# Altium schematic sheet RAM_Sheet_2.SchDoc
size A4; SheetNumber: 19; SheetTotal: 22
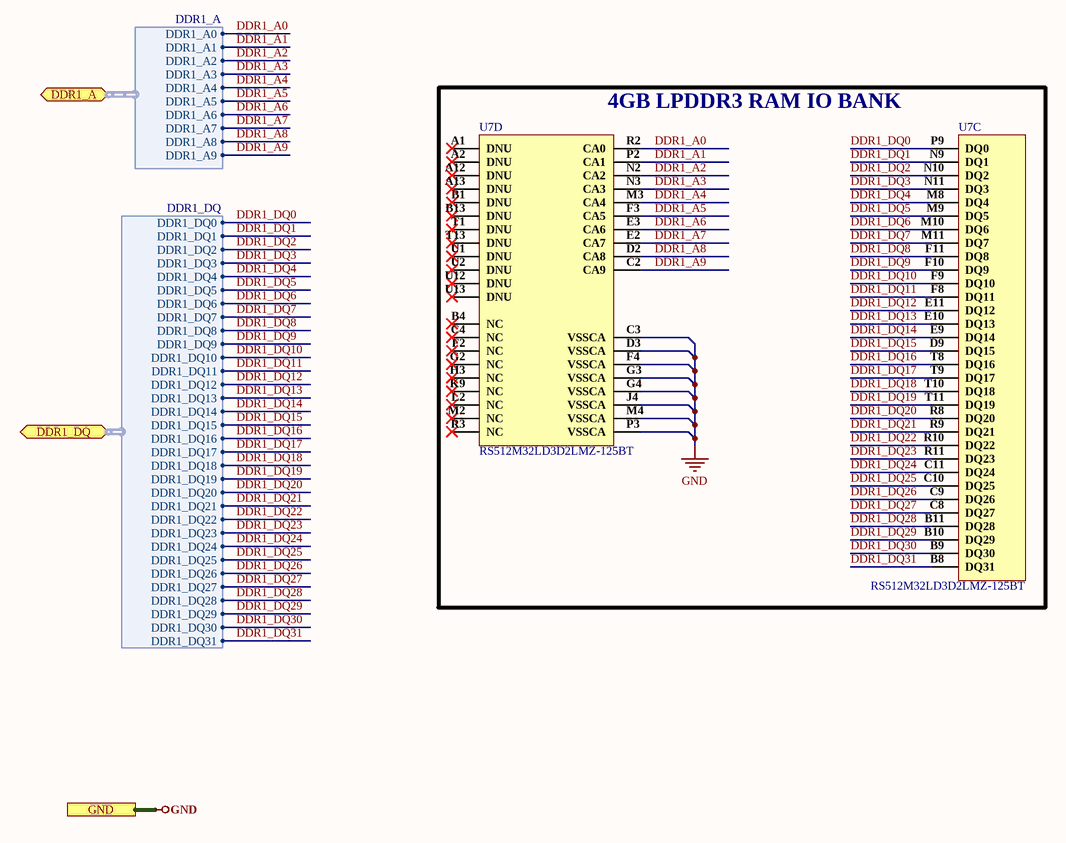
[diagram p0: RAM_Sheet_2.SchDoc]

## Parts
U7  RS512M32LD3D2LMZ-125BT  [FBGA-178 SDRAM]  (parts C,D of 5)

## Blocks framed on the sheet
4GB LPDDR3 RAM IO BANK: U7

## Ports
DDR1_A (bidir, harness DDR1_A), DDR1_DQ (bidir, harness DDR1_DQ), GND

## Harnesses
DDR1_DQ: DDR1_DQ0, DDR1_DQ1, DDR1_DQ2, DDR1_DQ3, DDR1_DQ4, DDR1_DQ5, DDR1_DQ6, DDR1_DQ7, DDR1_DQ8, DDR1_DQ9, DDR1_DQ10, DDR1_DQ11, DDR1_DQ12, DDR1_DQ13, DDR1_DQ14, DDR1_DQ15, DDR1_DQ16, DDR1_DQ17, DDR1_DQ18, DDR1_DQ19, DDR1_DQ20, DDR1_DQ21, DDR1_DQ22, DDR1_DQ23, DDR1_DQ24, DDR1_DQ25, DDR1_DQ26, DDR1_DQ27, DDR1_DQ28, DDR1_DQ29, DDR1_DQ30, DDR1_DQ31
DDR1_A: DDR1_A0, DDR1_A1, DDR1_A2, DDR1_A3, DDR1_A4, DDR1_A5, DDR1_A6, DDR1_A7, DDR1_A8, DDR1_A9

## Nets
GND: U7.C3(VSSCA) U7.D3(VSSCA) U7.F4(VSSCA) U7.G3(VSSCA) U7.G4(VSSCA) U7.J4(VSSCA) U7.M4(VSSCA) U7.P3(VSSCA) ; port GND
DDR1_A0: U7.R2(CA0) ; port DDR1_A.DDR1_A0
DDR1_A1: U7.P2(CA1) ; port DDR1_A.DDR1_A1
DDR1_A2: U7.N2(CA2) ; port DDR1_A.DDR1_A2
DDR1_A3: U7.N3(CA3) ; port DDR1_A.DDR1_A3
DDR1_A4: U7.M3(CA4) ; port DDR1_A.DDR1_A4
DDR1_A5: U7.F3(CA5) ; port DDR1_A.DDR1_A5
DDR1_A6: U7.E3(CA6) ; port DDR1_A.DDR1_A6
DDR1_A7: U7.E2(CA7) ; port DDR1_A.DDR1_A7
DDR1_A8: U7.D2(CA8) ; port DDR1_A.DDR1_A8
DDR1_A9: U7.C2(CA9) ; port DDR1_A.DDR1_A9
DDR1_DQ0: U7.P9(DQ0) ; port DDR1_DQ.DDR1_DQ0
DDR1_DQ1: U7.N9(DQ1) ; port DDR1_DQ.DDR1_DQ1
DDR1_DQ2: U7.N10(DQ2) ; port DDR1_DQ.DDR1_DQ2
DDR1_DQ3: U7.N11(DQ3) ; port DDR1_DQ.DDR1_DQ3
DDR1_DQ4: U7.M8(DQ4) ; port DDR1_DQ.DDR1_DQ4
DDR1_DQ5: U7.M9(DQ5) ; port DDR1_DQ.DDR1_DQ5
DDR1_DQ6: U7.M10(DQ6) ; port DDR1_DQ.DDR1_DQ6
DDR1_DQ7: U7.M11(DQ7) ; port DDR1_DQ.DDR1_DQ7
DDR1_DQ8: U7.F11(DQ8) ; port DDR1_DQ.DDR1_DQ8
DDR1_DQ9: U7.F10(DQ9) ; port DDR1_DQ.DDR1_DQ9
DDR1_DQ10: U7.F9(DQ10) ; port DDR1_DQ.DDR1_DQ10
DDR1_DQ11: U7.F8(DQ11) ; port DDR1_DQ.DDR1_DQ11
DDR1_DQ12: U7.E11(DQ12) ; port DDR1_DQ.DDR1_DQ12
DDR1_DQ13: U7.E10(DQ13) ; port DDR1_DQ.DDR1_DQ13
DDR1_DQ14: U7.E9(DQ14) ; port DDR1_DQ.DDR1_DQ14
DDR1_DQ15: U7.D9(DQ15) ; port DDR1_DQ.DDR1_DQ15
DDR1_DQ16: U7.T8(DQ16) ; port DDR1_DQ.DDR1_DQ16
DDR1_DQ17: U7.T9(DQ17) ; port DDR1_DQ.DDR1_DQ17
DDR1_DQ18: U7.T10(DQ18) ; port DDR1_DQ.DDR1_DQ18
DDR1_DQ19: U7.T11(DQ19) ; port DDR1_DQ.DDR1_DQ19
DDR1_DQ20: U7.R8(DQ20) ; port DDR1_DQ.DDR1_DQ20
DDR1_DQ21: U7.R9(DQ21) ; port DDR1_DQ.DDR1_DQ21
DDR1_DQ22: U7.R10(DQ22) ; port DDR1_DQ.DDR1_DQ22
DDR1_DQ23: U7.R11(DQ23) ; port DDR1_DQ.DDR1_DQ23
DDR1_DQ24: U7.C11(DQ24) ; port DDR1_DQ.DDR1_DQ24
DDR1_DQ25: U7.C10(DQ25) ; port DDR1_DQ.DDR1_DQ25
DDR1_DQ26: U7.C9(DQ26) ; port DDR1_DQ.DDR1_DQ26
DDR1_DQ27: U7.C8(DQ27) ; port DDR1_DQ.DDR1_DQ27
DDR1_DQ28: U7.B11(DQ28) ; port DDR1_DQ.DDR1_DQ28
DDR1_DQ29: U7.B10(DQ29) ; port DDR1_DQ.DDR1_DQ29
DDR1_DQ30: U7.B9(DQ30) ; port DDR1_DQ.DDR1_DQ30
DDR1_DQ31: U7.B8(DQ31) ; port DDR1_DQ.DDR1_DQ31

Not connected (* = marked no-connect by the designer): U7 A1(DNU)* A2(DNU)* A12(DNU)* A13(DNU)* B1(DNU)* B4(NC)* B13(DNU)* C4(NC)* F2(NC)* G2(NC)* H3(NC)* K9(NC)* L2(NC)* M2(NC)* R3(NC)* T1(DNU)* T13(DNU)* U1(DNU)* U2(DNU)* U12(DNU)* U13(DNU)*

## Notes on the sheet
- 1
- Huzaifa Ali

## Library data of the parts
U7 = RS512M32LD3D2LMZ-125BT: 16Gbit 800MHz 1.7V~1.95V -25℃~+85℃ FBGA-178 SDRAM ROHS; Manufacturer: Rayson; Manufacturer Part Number: RS512M32LD3D2LMZ-125BT; Footprint: FBGA-178